# Altium schematic sheet Title.SchDoc: =PJ_Name
size A4; SheetNumber: 1; SheetTotal: 16
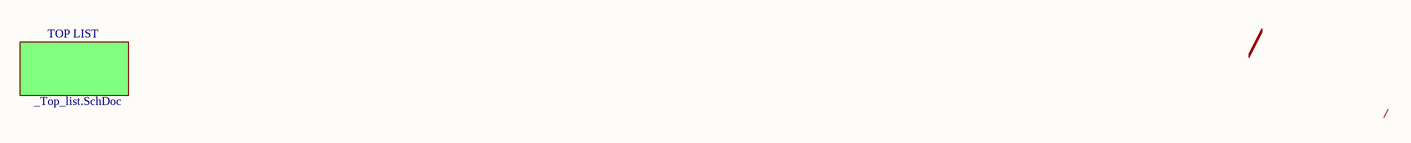
[diagram p0: Title.SchDoc]

## Sub-sheets
TOP LIST = _Top_list.SchDoc: no entries

## Notes on the sheet
- /